# Altium schematic sheet RP2040_Dev_Board.SchDoc: RP2040 Dev Board
size A3; DrawnBy: Brandon Kakimoto; Revision: 1.0; SheetNumber: 1; SheetTotal: 1
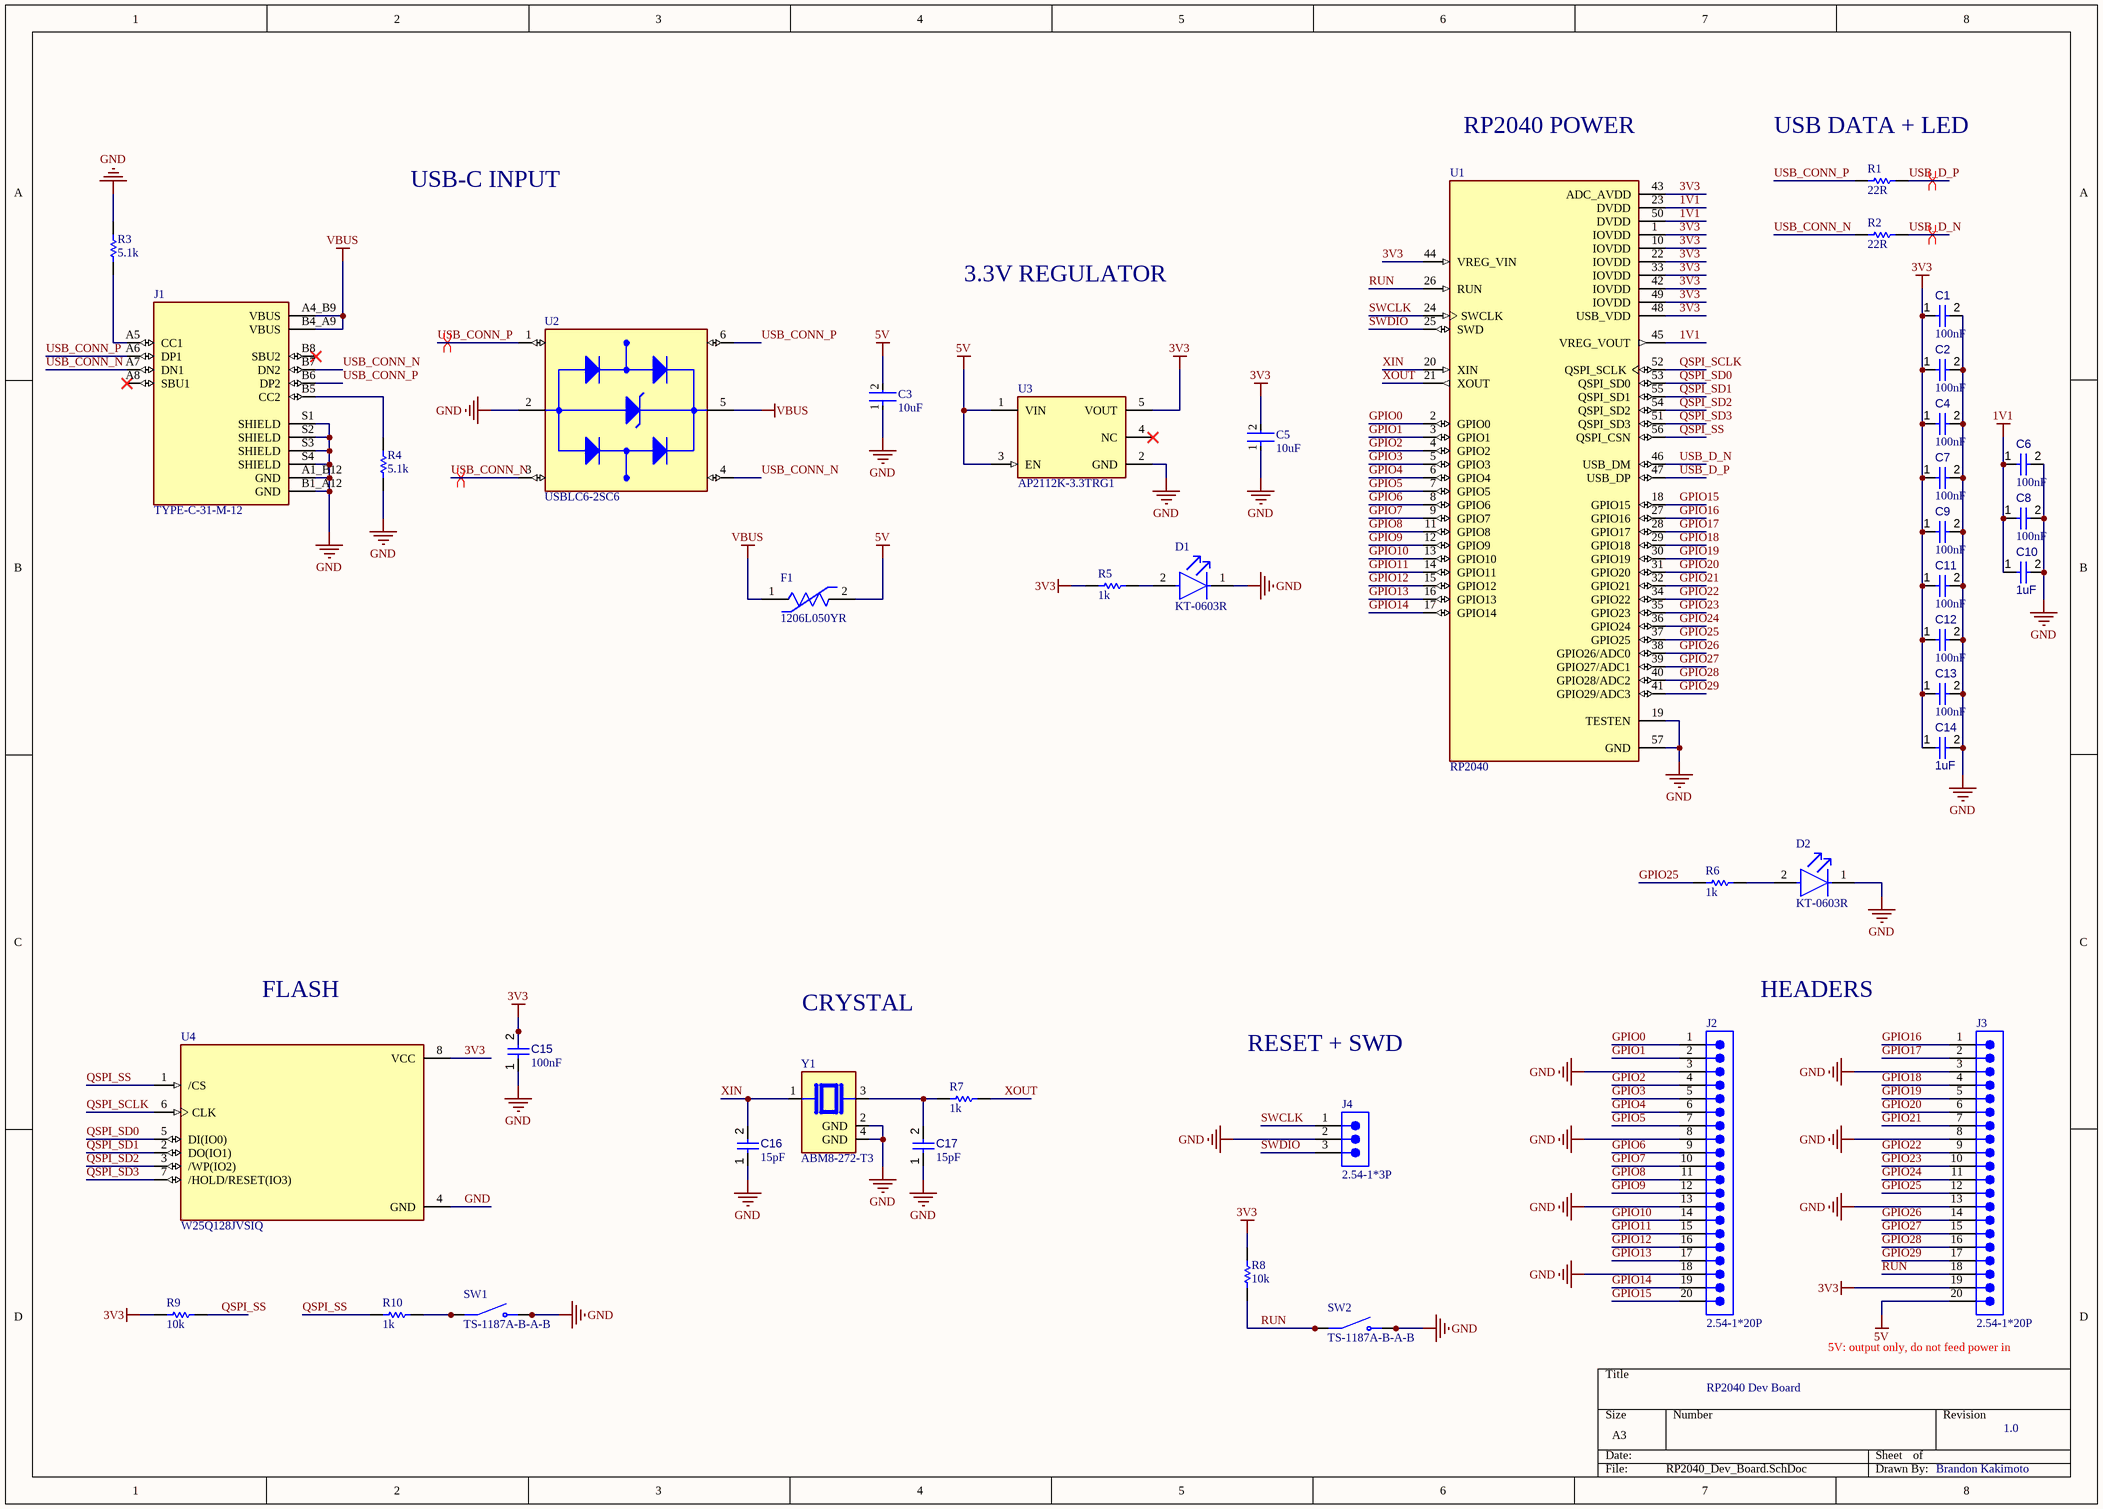
[diagram p0: RP2040_Dev_Board.SchDoc]

## Parts
C1  100nF  [CAPC1608X90X40NL10T20]
C2  100nF  [CAPC1608X90X40NL10T20]
C3  10uF  [FP-C0805C106K4PACTU-MFG]
C4  100nF  [CAPC1608X90X40NL10T20]
C5  10uF  [FP-C0805C106K4PACTU-MFG]
C6  100nF  [CAPC1608X90X40NL10T20]
C7  100nF  [CAPC1608X90X40NL10T20]
C8  100nF  [CAPC1608X90X40NL10T20]
C9  100nF  [CAPC1608X90X40NL10T20]
C10  1uF  [CAPC1608X90X40NL10T20]
C11  100nF  [CAPC1608X90X40NL10T20]
C12  100nF  [CAPC1608X90X40NL10T20]
C13  100nF  [CAPC1608X90X40NL10T20]
C14  1uF  [CAPC1608X90X40NL10T20]
C15  100nF  [CAPC1608X90X40NL10T20]
C16  15pF  [CAPC1608X90X40NL10T20]
C17  15pF  [CAPC1608X90X40NL10T20]
D1  KT-0603R  [FP-SML-D12-MFG]
D2  KT-0603R  [FP-SML-D12-MFG]
F1  1206L050YR  [FP-1206L050YR-MFG]
J1  TYPE-C-31-M-12  [HRO_TYPE-C-31-M-12]
J2  2.54-1*20P  [61302011121]
J3  2.54-1*20P  [61302011121]
J4  2.54-1*3P  [61300311121]
R1  22R  [RESC1608X55X25ML10T15]
R2  22R  [RESC1608X55X25ML10T15]
R3  5.1k  [RESC1608X55X25ML10T15]
R4  5.1k  [RESC1608X55X25ML10T15]
R5  1k  [RESC1608X55X25ML10T15]
R6  1k  [RESC1608X55X25ML10T15]
R7  1k  [RESC1608X55X25ML10T15]
R8  10k  [RESC1608X55X25ML10T15]
R9  10k  [RESC1608X55X25ML10T15]
R10  1k  [RESC1608X55X25ML10T15]
SW1  TS-1187A-B-A-B  [SW_TS-1187A-B-A-B]
SW2  TS-1187A-B-A-B  [SW_TS-1187A-B-A-B]
U1  RP2040  [QFN40P700X700X90-57N]
U2  USBLC6-2SC6  [SOT95P280X145-6N]
U3  AP2112K-3.3TRG1  [FP-SOT25-IPC_A]
U4  W25Q128JVSIQ  [SOIC127P790X216-8N]
Y1  ABM8-272-T3  [XTAL_ABM8-272-T3]

## Nets
1V1: C6.1 C8.1 C10.1 U1.23(DVDD) U1.45(VREG_VOUT) U1.50(DVDD)
3V3: C1.1 C2.1 C4.1 C5.2 C7.1 C9.1 C11.1 C12.1 C13.1 C14.1 C15.2 J3.19 R5.1 R8.2 R9.1 U1.1(IOVDD) U1.10(IOVDD) U1.22(IOVDD) U1.33(IOVDD) U1.42(IOVDD) U1.43(ADC_AVDD) U1.44(VREG_VIN) U1.48(USB_VDD) U1.49(IOVDD) U3.5(VOUT) U4.8(VCC)
5V: C3.2 F1.2 J3.20 U3.1(VIN) U3.3(EN)
GND: C1.2 C2.2 C3.1 C4.2 C5.1 C6.2 C7.2 C8.2 C9.2 C10.2 C11.2 C12.2 C13.2 C14.2 C15.1 C16.1 C17.1 D1.1(C) D2.1(C) J1.A1_B12(GND) J1.B1_A12(GND) J1.S1(SHIELD) J1.S2(SHIELD) J1.S3(SHIELD) J1.S4(SHIELD) J2.3 J2.8 J2.13 J2.18 J3.3 J3.8 J3.13 J4.2 R3.2 R4.1 SW1.C(NO) SW1.D(NO) SW2.C(NO) SW2.D(NO) U1.19(TESTEN) U1.57(GND) U2.2(GND) U3.2(GND) U4.4(GND) Y1.2(GND) Y1.4(GND)
VBUS: F1.1 J1.A4_B9(VBUS) J1.B4_A9(VBUS) U2.5(VBUS)
GPIO0: J2.1 U1.2(GPIO0)
GPIO1: J2.2 U1.3(GPIO1)
GPIO2: J2.4 U1.4(GPIO2)
GPIO3: J2.5 U1.5(GPIO3)
GPIO4: J2.6 U1.6(GPIO4)
GPIO5: J2.7 U1.7(GPIO5)
GPIO6: J2.9 U1.8(GPIO6)
GPIO7: J2.10 U1.9(GPIO7)
GPIO8: J2.11 U1.11(GPIO8)
GPIO9: J2.12 U1.12(GPIO9)
GPIO10: J2.14 U1.13(GPIO10)
GPIO11: J2.15 U1.14(GPIO11)
GPIO12: J2.16 U1.15(GPIO12)
GPIO13: J2.17 U1.16(GPIO13)
GPIO14: J2.19 U1.17(GPIO14)
GPIO15: J2.20 U1.18(GPIO15)
GPIO16: J3.1 U1.27(GPIO16)
GPIO17: J3.2 U1.28(GPIO17)
GPIO18: J3.4 U1.29(GPIO18)
GPIO19: J3.5 U1.30(GPIO19)
GPIO20: J3.6 U1.31(GPIO20)
GPIO21: J3.7 U1.32(GPIO21)
GPIO22: J3.9 U1.34(GPIO22)
GPIO23: J3.10 U1.35(GPIO23)
GPIO24: J3.11 U1.36(GPIO24)
GPIO25: J3.12 R6.1 U1.37(GPIO25)
GPIO26: J3.14 U1.38(GPIO26/ADC0)
GPIO27: J3.15 U1.39(GPIO27/ADC1)
GPIO28: J3.16 U1.40(GPIO28/ADC2)
GPIO29: J3.17 U1.41(GPIO29/ADC3)
QSPI_SCLK: U1.52(QSPI_SCLK) U4.6(CLK)
QSPI_SD0: U1.53(QSPI_SD0) U4.5(DI(IO0))
QSPI_SD1: U1.55(QSPI_SD1) U4.2(DO(IO1))
QSPI_SD2: U1.54(QSPI_SD2) U4.3(/WP(IO2))
QSPI_SD3: U1.51(QSPI_SD3) U4.7(/HOLD/RESET(IO3))
QSPI_SS: R9.2 R10.1 U1.56(QSPI_CSN) U4.1(/CS)
RUN: J3.18 R8.1 SW2.A(COM) SW2.B(COM) U1.26(RUN)
SWCLK: J4.1 U1.24(SWCLK)
SWDIO: J4.3 U1.25(SWD)
USB_CONN_N: J1.A7(DN1) J1.B7(DN2) R2.1 U2.3(I/O2_IN) U2.4(I/O2_OUT)
USB_CONN_P: J1.A6(DP1) J1.B6(DP2) R1.1 U2.1(I/O1_IN) U2.6(I/O1_OUT)
USB_D_N: R2.2 U1.46(USB_DM)
USB_D_P: R1.2 U1.47(USB_DP)
XIN: C16.2 U1.20(XIN) Y1.1
XOUT: R7.2 U1.21(XOUT)
NetC17_2: C17.2 R7.1 Y1.3
NetD1_2: D1.2(A) R5.2
NetD2_2: D2.2(A) R6.2
NetJ1_A5: J1.A5(CC1) R3.1
NetJ1_B5: J1.B5(CC2) R4.2
NetR10_2: R10.2 SW1.A(COM) SW1.B(COM)

Not connected (* = marked no-connect by the designer): J1 A8(SBU1)* B8(SBU2)*; U3 4(NC)*

## Layout directives
differential pair: USB_CONN_N, USB_CONN_P, USB_D_N, USB_D_P

## Notes on the sheet
- RP2040 POWER
- (near R1) USB DATA + LED
- USB-C INPUT
- 3.3V REGULATOR
- FLASH
- CRYSTAL
- RESET + SWD
- HEADERS
- (near J3) 5V: output only, do not feed power in

## Library data of the parts
C1 C2 C4 C6-C9 C11-C13 C15 = CMP-001-00017-6: Chip Capacitor, 100 nF, +/- 10%, 50 V, 0603 (1608 Metric); Voltage Rating: 50V; Capacitor Type: Ceramic; Tolerance: 10%; Mounting Technology: SM; Value: 100nF; Max Operating Temperature: 125°C; RoHS Compliant: True; Pins: 2; Case/Package: 0603; Min Operating Temperature: -55°C; LCSC: C14663
C3 C5 = CMP-03020-034671-1: CAP CER 10UF 16V X5R 0805; Dissipation Factor: 5%; Tolerance: 10%; Dielectric Material: Ceramic; REACH SVHC: No SVHC; Packaging: Tape and Reel; Series: C; Min Operating Temperature: -55°C; Construction: Flat; Radiation Hardening: No; Case Code (Metric): 2012; Contact Plating: Tin; Case Code (Imperial): 0805; Voltage Rating: 16V; Mount: Surface Mount; Width: 0.049inch; Voltage: 16V; Dielectric: X5R; Height: 1.25mm; Depth: 1.25mm; Case/Package: 0805; Max Operating Temperature: 85°C; Length: 2mm; Thickness: 0.055inch; Termination: SMD/SMT; Capacitance: 10uF; Number of Pins: 2; Voltage Rating (DC): 16V; Lead Free: Lead Free; Package Quantity: 1; LCSC: C15850
C10 C14 = CMP-001-00017-6: 1uF 50V X5R ±10% 0603 Multilayer Ceramic Capacitors MLCC - SMD/SMT ROHS; Tolerance: 10%; Voltage Rating: 50V; Mounting Technology: SM; Value: 1uF; Max Operating Temperature: 125°C; RoHS Compliant: True; Pins: 2; Capacitor Type: Ceramic; Case/Package: 0603; Min Operating Temperature: -55°C; LCSC: C15849
C16 C17 = CMP-001-00017-6: CAP CER 15pF 50V C0G 0603; Tolerance: 10%; Capacitor Type: Ceramic; Voltage Rating: 50V; Mounting Technology: SM; Value: 15pF; Max Operating Temperature: 125°C; RoHS Compliant: True; Pins: 2; Case/Package: 0603; Min Operating Temperature: -55°C; LCSC: C1644
D1 D2 = CMP-08952-000014-1: LED RED 1608 SMD; Manufacturer Part Number: SML-D12U8WT86C; Manufacturer: Rohm; Reverse Voltage: 5V; Wavelength: 620nm; Luminous Intensity: 63mcd; Automotive Grade: Grade 3; Forward Voltage: 2.2V; Led Orientation: Top View; Forward Current: 20mA; Power Dissipation: 54mW; Mouser Description: LED Uni-Color Red Automotive 2-Pin Chip 0603(1608Metric) T/R; Colour: Red; ComponentLink2Description: Datasheet; Category: Diode; Package: SML-D12; RoHS: TRUE; Temperature Range Low: -40°C; Lead Free: Yes; Height: 0.65mm; Digikey Description: LED RED 1608 SMD; Octopart: https://octopart.com/sml-d12u8wt86c-rohm-77740214; Device Class L3: unset; Temperature Range High: +85°C; Device Class L1: Optoelectronics; ComponentLink2URL: https://fscdn.rohm.com/en/products/databook/datasheet/opto/led/chip_mono/sml-d12x8(c)-e.pdf; Device Class L2: LEDs; Temperature: -40°C to +85°C; Automotive: Yes; LCSC: C2286
F1 = CMP-08606-000073-1: PTC RESET FUSE 6V 500MA 1206; Trip Current: 1A; Current Rating: 100A; Resistance: 700mR; Approvals: cULus; Max Power Dissipation: 600mW; Time to Trip: 0.1s; Hold Current: 500mA; Min Operating Temperature: -40°C; Voltage Rating (DC): 6V; Working Voltage: 6V; Package Quantity: 4000; Termination: SMD/SMT; Lead Free: Lead Free; REACH SVHC: No SVHC; Series: 1206L; Max Voltage Rating (DC): 6V; Height: 0.75mm; Terminal Material: Copper; Packaging: Tape and Reel; Case Code (Imperial): 1206; Length: 3.4mm; RoHS Compliant: Yes; Operating Supply Voltage: 6V; Case Code (Metric): 3216; Width: 1.8mm; Max Current Rating: 100A; Case/Package: 1206; Power Dissipation: 600mW; Max Operating Temperature: 85°C; Voltage Rating: 6V; LCSC: C163512
J1 = CMP-009-000000-1: USB Connectors 24 Receptacle 1 8.94*7.3mm RoHS; MF: HRO Electronics Co., Ltd.; Pin Count: 16; Component Type: Standard; Design Item ID: TYPE-C-31-M-12; Package: Package; SnapEDA_Link: https://www.snapeda.com/parts/TYPE-C-31-M-12/HRO+Electronics+Co.%252C+Ltd./view-part/?ref=snap; Value: *; Check_prices: https://www.snapeda.com/parts/TYPE-C-31-M-12/HRO+Electronics+Co.%252C+Ltd./view-part/?ref=eda; Source: TYPE-C-31-M-12.SchLib; MP: TYPE-C-31-M-12; LCSC: C165948
J2 J3 = CMP-1502-01102-4: THT Vertical Pin Header WR-PHD, Pitch 2.54 mm, Single Row, 20 pins; Current Rating: 3A; Contact Resistance: 20mΩ; Operating Supply Voltage: 250V; Gender: Male; Connector Type: Male Pin; Number of Positions: 20; Pitch: 2.54mm; Contact Mating Length: 5.9944mm; Contact Plating: Gold; Termination: Solder; RoHS: Compliant; Mount: Through Hole; Contact Material: Copper; Orientation: Vertical; Color: Black; Number of Rows: 1; Number of Pins: 20; Number of Contacts: 20; Lead Pitch: 2.54mm; Packaging: Bulk; LCSC: C50981
J4 = CMP-1502-01062-4: THT Vertical Pin Header WR-PHD, Pitch 2.54 mm, Single Row, 3 pins; Connector Type: Male Pin; Number of Contacts: 3; Operating Supply Voltage: 250V; Current Rating: 3A; Pitch: 2.54mm; Contact Resistance: 20mΩ; Gender: Male; Height: 8.94mm; Color: Black; Min Operating Temperature: -40°C; Max Operating Temperature: 105°C; Mount: Through Hole; Termination: Solder; Number of Rows: 1; Packaging: Bulk; Number of Pins: 3; Lead Pitch: 2.54mm; RoHS: Compliant; Contact Plating: Gold; Number of Positions: 3; Lead Free: Lead Free; Voltage Rating: 250V; Contact Mating Length: 5.9944mm; Orientation: Vertical; Contact Material: Gold; LCSC: C49257
R1-R10 = CMP-2000-04177-1: Part Number: RC0603FR-1020KL; Manufacturer: Yageo
  R1 R2: LCSC: C23345
  R3 R4: LCSC: C23186
  R5-R7 R10: LCSC: C21190
  R8 R9: LCSC: C25804
SW1 SW2 = CMP-011-000000-3: SPST 50mA @ 12VDC Top Actuated Round Button 160gf SMD Tactile Switches RoHS; Component Type: Standard; Source: TS-1187A-B-A-B.SchLib; Value: *; Availability: Unavailable; Pin Count: 4; Package: None; MP: TS-1187A-B-A-B; Price: None; Design Item ID: TS-1187A-B-A-B; LCSC: C318884
U1 = CMP-003-000000-1: RP2040 chip for Raspberry Pi Pico - ARM® Cortex®-M0+ MCU 32-Bit; Check_prices: https://www.snapeda.com/parts/RP2040/Raspberry+Pi/view-part/?ref=eda; Pin Count: 57; Component Type: Standard; Package: None; MF: Raspberry Pi; SnapEDA_Link: https://www.snapeda.com/parts/RP2040/Raspberry+Pi/view-part/?ref=snap; MP: RP2040; Source: RP2040.SchLib; Design Item ID: RP2040; Value: *; LCSC: C2040
U2 = CMP-004-00031-1: 17V Clamp 5A (8/20Âµs) Ipp Tvs Diode Surface Mount SOT-23-6; MF: STMicroelectronics; Purchase-URL: https://pricing.snapeda.com/search/part/USBLC6-2SC6/?ref=eda; Value: *; MP: USBLC6-2SC6; Availability: In Stock; Price: None; Component Type: Standard; Source: USBLC6-2SC6.SchLib; Design Item ID: USBLC6-2SC6; SnapEDA_Link: https://www.snapeda.com/parts/USBLC6-2SC6/STMicroelectronics/view-part/?ref=snap; Pins: 6; Check_prices: https://www.snapeda.com/parts/USBLC6-2SC6/STMicroelectronics/view-part/?ref=eda; Case/Package: SOT-23-6 STMicroelectronics; LCSC: C7519
U3 = CMP-12756-000035-1: IC REG LINEAR 3.3V 600MA SOT25; Number of Regulators: 1; Output Type: Fixed; Polarity: Positive; Min Input Voltage: 2.5V; Max Input Voltage: 6V; Accuracy: 1.5%; Quiescent Current: 55uA; Dropout Voltage: 250mV; Min Operating Temperature: -40°C; Length: 3.1mm; Output Current: 600mA; Max Operating Temperature: 85°C; Package Quantity: 1; Output Voltage: 3.3V; Width: 1.7mm; Number of Outputs: 1; Packaging: Tape and Reel; Height: 1.3mm; Lead Free: Lead Free; Max Output Current: 600mA; Case/Package: SOT-23-5; Mount: Surface Mount; Number of Pins: 5; LCSC: C51118
U4 = CMP-031-00006-1: FLASH - NOR Memory IC 128Mb (16M x 8) SPI - Quad I/O, QPI, DTR 133 MHz 8-SOIC; MF: Winbond Electronics; Case/Package: SOIC-8 Winbond Electronics; Check_prices: https://www.snapeda.com/parts/W25Q128JVSIQ/Winbond/view-part/?ref=eda; Component Type: Standard; Value: *; Pins: 8; MP: W25Q128JVSIQ; SnapEDA_Link: https://www.snapeda.com/parts/W25Q128JVSIQ/Winbond/view-part/?ref=snap; Design Item ID: W25Q128JVSIQ; Source: W25Q128JVSIQ.SchLib; LCSC: C97521
Y1 = CMP-003-00030-1: 12 MHz Â±30ppm Crystal 10pF 50 Ohms 4-SMD, No Lead; MF: ABRACON; Value: *; Check_prices: https://www.snapeda.com/parts/ABM8-272-T3/Abracon/view-part/?ref=eda; Design Item ID: ABM8-272-T3; MP: ABM8-272-T3; Source: ABM8-272-T3.SchLib; Case/Package: NON-STANDARD-4 Abracon; Pins: 4; SnapEDA_Link: https://www.snapeda.com/parts/ABM8-272-T3/Abracon/view-part/?ref=snap; Component Type: Standard; LCSC: C20625731